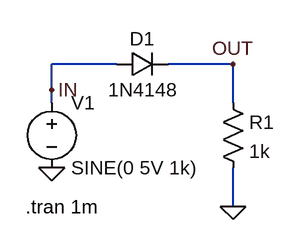
[diagram p0: schematic Example-7-2-a.asc]
Example-7-2-a.asc, the LTspice schematic file:
Version 4.1
SHEET 1 880 680
WIRE 192 32 112 32
WIRE 336 32 256 32
WIRE 112 64 112 32
WIRE 112 80 112 64
WIRE 336 80 336 32
WIRE 336 208 336 160
FLAG 112 160 0
FLAG 336 208 0
FLAG 112 64 IN
FLAG 336 32 OUT
SYMBOL voltage 112 64 R0
WINDOW 123 0 0 Left 0
WINDOW 39 0 0 Left 0
SYMATTR InstName V1
SYMATTR Value SINE(0 5V 1k)
SYMBOL diode 192 48 R270
WINDOW 0 32 32 VTop 2
WINDOW 3 0 32 VBottom 2
SYMATTR InstName D1
SYMATTR Value 1N4148
SYMBOL res 320 64 R0
SYMATTR InstName R1
SYMATTR Value 1k
TEXT 80 208 Left 2 !.tran 1m

The netlist it stands for:
* Example-7-2-a.asc
V1 IN 0 SINE(0 5V 1k)
D1 IN OUT 1N4148
R1 OUT 0 1k
.model D D
.lib standard.dio
.tran 1m
.backanno
.end

* Results of the author's LTspice run, read from the files saved beside the schematic
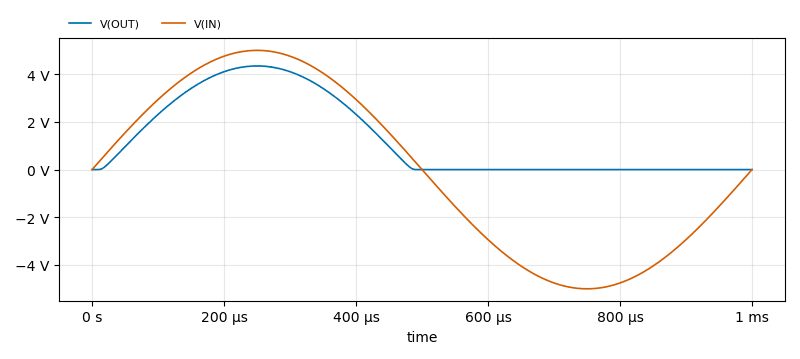
[diagram p1: Transient Analysis of Example-7-2-a.asc, plotted from the saved traces]
* Transient Analysis, 1 run:
*   V(OUT): min -126.4 µV, max 4.347 V, average 1.293 V, rms 2.101 V, last 125.7 µV
*   V(IN): min -5 V, max 5 V, average 0 V, rms 3.536 V, last 0 V